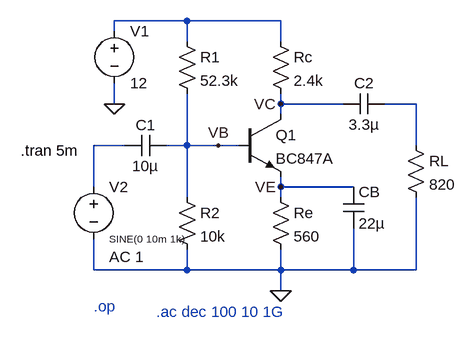
[diagram p0: schematic BJT-CEamplifier.asc]
BJT-CEamplifier.asc, the LTspice schematic file:
Version 4.1
SHEET 1 880 680
WIRE 96 0 -16 0
WIRE 240 0 96 0
WIRE -16 16 -16 0
WIRE 96 32 96 0
WIRE 240 32 240 0
WIRE -16 128 -16 96
WIRE 240 128 240 112
WIRE 336 128 240 128
WIRE 448 128 400 128
WIRE 240 144 240 128
WIRE 0 192 -48 192
WIRE 96 192 96 112
WIRE 96 192 64 192
WIRE 144 192 96 192
WIRE 176 192 144 192
WIRE 448 192 448 128
WIRE -48 256 -48 192
WIRE 240 256 240 240
WIRE 352 256 240 256
WIRE 96 272 96 192
WIRE 240 272 240 256
WIRE -48 384 -48 336
WIRE 96 384 96 352
WIRE 96 384 -48 384
WIRE 240 384 240 352
WIRE 240 384 96 384
WIRE 352 384 352 320
WIRE 352 384 240 384
WIRE 448 384 448 272
WIRE 448 384 352 384
WIRE 240 416 240 384
FLAG 240 416 0
FLAG -16 128 0
FLAG 144 192 VB
FLAG 240 128 VC
FLAG 240 256 VE
SYMBOL npn 176 144 R0
SYMATTR InstName Q1
SYMATTR Value BC847A
SYMBOL res 224 16 R0
SYMATTR InstName Rc
SYMATTR Value 2.4k
SYMBOL res 224 256 R0
SYMATTR InstName Re
SYMATTR Value 560
SYMBOL res 80 256 R0
SYMATTR InstName R2
SYMATTR Value 10k
SYMBOL res 80 16 R0
SYMATTR InstName R1
SYMATTR Value 52.3k
SYMBOL voltage -16 0 R0
WINDOW 123 0 0 Left 0
WINDOW 39 0 0 Left 0
SYMATTR InstName V1
SYMATTR Value 12
SYMBOL cap 400 112 R90
WINDOW 0 0 32 VBottom 2
WINDOW 3 32 32 VTop 2
SYMATTR InstName C2
SYMATTR Value 3.3µ
SYMBOL res 432 176 R0
SYMATTR InstName RL
SYMATTR Value 820
SYMBOL cap 64 176 R90
WINDOW 0 0 32 VBottom 2
WINDOW 3 32 32 VTop 2
SYMATTR InstName C1
SYMATTR Value 10µ
SYMBOL voltage -48 240 R0
WINDOW 123 24 124 Left 2
WINDOW 39 0 0 Left 0
WINDOW 3 24 96 Left 1
SYMATTR Value2 AC 1
SYMATTR InstName V2
SYMATTR Value SINE(0 10m 1k)
SYMBOL cap 336 256 R0
SYMATTR InstName CB
SYMATTR Value 22µ
TEXT -48 440 Left 2 ;.op
TEXT -160 200 Left 2 !.tran 5m
TEXT 48 448 Left 2 ;.ac dec 100 10 1G

The netlist it stands for:
* BJT-CEamplifier.asc
Q1 VC VB VE 0 BC847A
Rc N001 VC 2.4k
Re VE 0 560
R2 VB 0 10k
R1 N001 VB 52.3k
V1 N001 0 12
C2 N002 VC 3.3µ
RL N002 0 820
C1 VB N003 10µ
V2 N003 0 SINE(0 10m 1k) AC 1
CB VE 0 22µ
.model NPN NPN
.model PNP PNP
.lib standard.bjt
* .op
.tran 5m
* .ac dec 100 10 1G
.backanno
.end